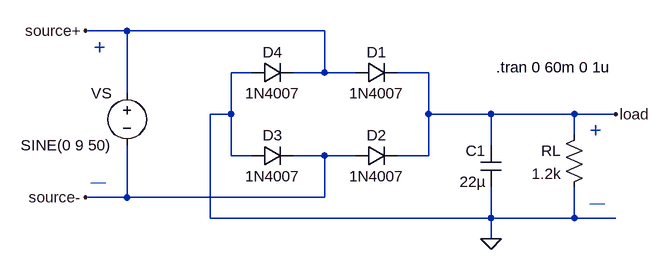
[diagram p0: schematic full-wave_bridge_rectifier.asc]
full-wave_bridge_rectifier.asc, the LTspice schematic file:
Version 4.1
SHEET 1 2364 680
WIRE 128 160 64 160
WIRE 432 160 128 160
WIRE 320 224 288 224
WIRE 432 224 432 160
WIRE 432 224 384 224
WIRE 480 224 432 224
WIRE 592 224 544 224
WIRE 128 256 128 160
WIRE 288 288 288 224
WIRE 288 288 256 288
WIRE 592 288 592 224
WIRE 688 288 592 288
WIRE 816 288 688 288
WIRE 880 288 816 288
WIRE 816 320 816 288
WIRE 688 336 688 288
WIRE 288 352 288 288
WIRE 320 352 288 352
WIRE 432 352 384 352
WIRE 480 352 432 352
WIRE 592 352 592 288
WIRE 592 352 544 352
WIRE 128 416 128 336
WIRE 128 416 64 416
WIRE 432 416 432 352
WIRE 432 416 128 416
WIRE 256 448 256 288
WIRE 688 448 688 400
WIRE 688 448 256 448
WIRE 816 448 816 400
WIRE 816 448 688 448
WIRE 880 448 816 448
WIRE 688 480 688 448
FLAG 688 480 0
FLAG 880 288 load
FLAG 64 160 source+
FLAG 64 416 source-
SYMBOL voltage 128 240 M0
WINDOW 123 0 0 Left 0
WINDOW 39 0 0 Left 0
SYMATTR InstName VS
SYMATTR Value SINE(0 9 50)
SYMBOL diode 480 240 R270
WINDOW 0 32 32 VTop 2
WINDOW 3 0 32 VBottom 2
SYMATTR InstName D1
SYMATTR Value 1N4007
SYMBOL diode 480 368 R270
WINDOW 0 32 32 VTop 2
WINDOW 3 0 32 VBottom 2
SYMATTR InstName D2
SYMATTR Value 1N4007
SYMBOL diode 320 368 R270
WINDOW 0 32 32 VTop 2
WINDOW 3 0 32 VBottom 2
SYMATTR InstName D3
SYMATTR Value 1N4007
SYMBOL diode 320 240 R270
WINDOW 0 32 32 VTop 2
WINDOW 3 0 32 VBottom 2
SYMATTR InstName D4
SYMATTR Value 1N4007
SYMBOL cap 704 336 M0
SYMATTR InstName C1
SYMATTR Value 22µ
SYMBOL res 832 304 M0
SYMATTR InstName RL
SYMATTR Value 1.2k
TEXT 840 312 Left 3 ;+
TEXT 840 424 Left 2 ;—
TEXT 96 184 Right 3 ;+
TEXT 96 392 Right 2 ;—
TEXT 696 216 Left 2 !.tran 0 60m 0 1u
TEXT 1696 352 Invisible 2 !.meas TRAN VloadPeak MAX V(load) FROM 40m TO 60m

The netlist it stands for:
* full-wave_bridge_rectifier.asc
VS source+ source- SINE(0 9 50)
D1 source+ load 1N4007
D2 source- load 1N4007
D3 0 source- 1N4007
D4 0 source+ 1N4007
C1 load 0 22µ
RL load 0 1.2k
.model D D
.lib standard.dio
* +
* —
* +
* —
.tran 0 60m 0 1u
.meas TRAN VloadPeak MAX V(load) FROM 40m TO 60m
.backanno
.end